# Altium schematic sheet DAC.SchDoc: DAC
size A4; Organization: Altium Limited; Address1: L3, 12a Rodborough Rd; Address2: Frenchs Forest; Address3: NSW; Address4: Australia 2086
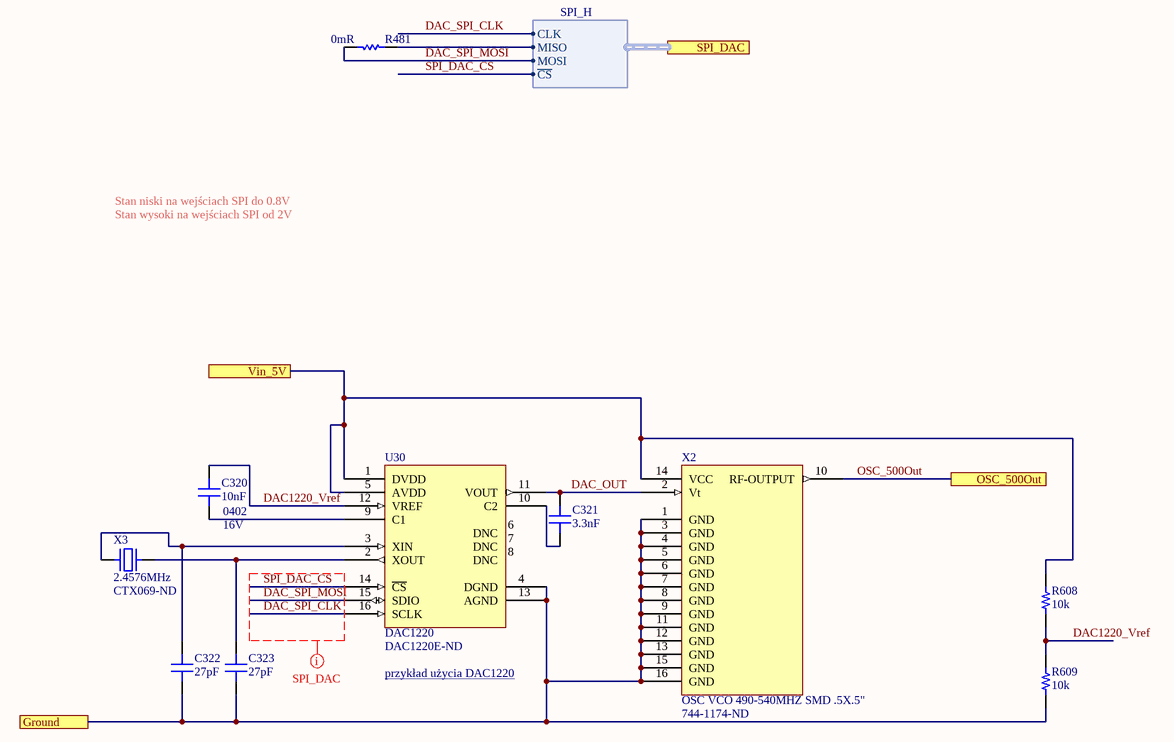
[diagram p0: DAC.SchDoc]

## Parts
C320  10nF  Case/Package: 0402  Voltage Rating (DC): 16V  [CAP 0402/1005 KK]
C321  3.3nF  [CAP 0603/1608 RF]
C322  27pF  [CAP 0402/1005 KK]
C323  27pF  [CAP 0402/1005 KK]
R481  0mR  [RES 0402/1005 RF KK]
R608  10k  [RES 0402/1005 RF KK]
R609  10k  [RES 0402/1005 RF KK]
U30  DAC1220  Supplier Part Number 1: DAC1220E-ND  [DAC1220]
X2  OSC VCO 490-540MHZ SMD .5X.5"  Supplier Part Number 1: 744-1174-ND  [CVCO55CW]
X3  2.4576MHz  Supplier Part Number 1: CTX069-ND  [Crystal]

## Ports
Ground, OSC_500Out, SPI_DAC (harness SPI_H), Vin_5V

## Harnesses
SPI_H: CLK, MISO, MOSI, ~{CS}

## Nets
DAC1220_Vref: C320.1 R608.2 R609.1 U30.12(VREF)
DAC_OUT: C321.2 U30.11(VOUT) X2.2(Vt)
DAC_SPI_CLK: U30.16(SCLK) ; port SPI_DAC.CLK
DAC_SPI_MOSI: R481.1 U30.15(SDIO) ; port SPI_DAC.MOSI
Ground: C322.1 C323.1 R609.2 U30.4(DGND) U30.13(AGND) X2.1(GND) X2.3(GND) X2.4(GND) X2.5(GND) X2.6(GND) X2.7(GND) X2.8(GND) X2.9(GND) X2.11(GND) X2.12(GND) X2.13(GND) X2.15(GND) X2.16(GND) ; port Ground
OSC_500Out: X2.10(RF-OUTPUT) ; port OSC_500Out
SPI_DAC_CS: U30.14(~{CS}) ; port SPI_DAC.~{CS}
Vin_5V: R608.1 U30.1(DVDD) U30.5(AVDD) X2.14(VCC) ; port Vin_5V
NetC320_2: C320.2 U30.9(C1)
NetC321_1: C321.1 U30.10(C2)
NetC322_2: C322.2 U30.3(XIN) X3.1
NetC323_2: C323.2 U30.2(XOUT) X3.2
NetR481_2: R481.2 ; port SPI_DAC.MISO

Not connected (* = marked no-connect by the designer): U30 6(DNC) 7(DNC) 8(DNC)

## Layout directives
net class SPI_DAC: DAC_SPI_CLK, DAC_SPI_MOSI, SPI_DAC_CS

## Notes on the sheet
- Stan niski na wejściach SPI do 0.8V
- Stan wysoki na wejściach SPI od 2V
- przykład użycia DAC1220 <http://www.ti.com/lit/ug/sbau102/sbau102.pdf>
- Title
- Size:
- Date:
- A3
- Number:
- Time:
- Revision:
- Sheet
- of
- File:

## Library data of the parts
C320 = Capacitor: Manufacturer: KEMET; Manufacturer Part Number: C0402C103K4RACTU; Dielectric Material: Ceramic; Tolerance: 10%; Dielectric: X7R; Dissipation Factor: 3.5%; Supplier 1: Digi-Key; Supplier Part Number 1: 399-1038-1-ND; Stock 1: 1112674; Pricing 1: 1 = 0,10000, 10 = 0,02800, 100 = 0,01240, 500 = 0,00886, 1000 = 0,00696, 2500 = 0,00632, 5000 = 0,00582 (USD); RoHS: Yes; Mount: Surface Mount,PCB; Number of Pins: 2; Case Code (Metric): 1005; Case Code (Imperial): 0402; Contact Plating: Tin,Matte; Min Operating Temperature: -55°C; Max Operating Temperature: 125°C; Capacitance: 10nF; Packaging: Tape and Reel; Package Quantity: 1; Voltage Rating: 16V; Termination: SMD/SMT; Voltage: 16V; Length: 1mm; Height: 0.5mm; Width: 0.02inch; Depth: 0.5mm; Thickness: 0.022inch; Lead Pitch: 0.3mm; Radiation Hardening: No; REACH SVHC: No SVHC; ComponentLink1URL: https://datasheet.ciiva.com/14595/70095383-14595321.pdf?src-supplier=Allied+Electronics; ComponentLink1Description: https://datasheet.ciiva.com/14595/70095383-14595321.pdf?src-supplier=Allied+Electronics; ComponentLink2URL: https://datasheet.ciiva.com/7747/kem-c1002-x7r-smd-7747614.pdf?src-supplier=Element14; ComponentLink2Description: https://datasheet.ciiva.com/7747/kem-c1002-x7r-smd-7747614.pdf?src-supplier=Element14
C321 = Capacitor: Manufacturer: Wurth Electronics; Manufacturer Part Number: 885012006016; Voltage Rating: 10V; Tolerance: 5%; Supplier 1: Digi-Key; Supplier Part Number 1: 732-7759-1-ND; Stock 1: 3926; Pricing 1: 1 = 0,10000, 10 = 0,08500, 100 = 0,07590, 500 = 0,06712 (USD); RoHS: Yes; Mount: Surface Mount; Case/Package: 0603; Case Code (Metric): 1608; Case Code (Imperial): 0603; Min Operating Temperature: -55°C; Max Operating Temperature: 125°C; Packaging: Tape and Reel; Capacitance: 3.3nF; Length: 0.063inch; Width: 0.031inch; Thickness: 0.034inch; ComponentLink1URL: https://katalog.we-online.de/pbs/datasheet/885012006016.pdf?src-supplier=Digi-Key; ComponentLink1Description: https://katalog.we-online.de/pbs/datasheet/885012006016.pdf?src-supplier=Digi-Key
C322 C323 = Capacitor: Manufacturer: KEMET; Manufacturer Part Number: C0402C270K5GACTU; Dielectric Material: Ceramic; Tolerance: 10%; Voltage Rating (DC): 50V; Dielectric: C0G; Supplier 1: Digi-Key; Supplier Part Number 1: 399-8960-1-ND; Stock 1: 1014365; Pricing 1: 1 = 0,10000, 10 = 0,02000, 100 = 0,00900, 500 = 0,00644, 1000 = 0,00506, 2500 = 0,00460, 5000 = 0,00423 (USD); RoHS: Yes; Mount: Surface Mount; Case/Package: 0402; Case Code (Metric): 1005; Case Code (Imperial): 0402; Min Operating Temperature: -55°C; Max Operating Temperature: 125°C; Capacitance: 27pF; Packaging: Tape and Reel; Package Quantity: 1; Voltage Rating: 50V; Termination: SMD/SMT; Length: 1mm; Height: 0.5mm; Depth: 0.5mm; Width: 0.02inch; Thickness: 0.022inch; Lead Pitch: 0.3mm; Lead Free: Lead Free; ComponentLink1URL: https://datasheet.ciiva.com/5413/kem-c1003-c0g-smd-5413929.pdf?src-supplier=Mouser; ComponentLink1Description: https://datasheet.ciiva.com/5413/kem-c1003-c0g-smd-5413929.pdf?src-supplier=Mouser
R481 = Resistor: Manufacturer 1: Yageo; Manufacturer Part Number 1: RC0402JR-070RL; Power Rating: 62.5mW; Tolerance: 5%; Voltage Rating: 50V; Max Power Dissipation: 63mW; Temperature Coefficient: 200ppm/°C; Supplier 1: Digi-Key; Supplier Part Number 1: 311-0.0JRCT-ND; Stock 1: 69822252; Pricing 1: 1=0.10000, 10=0.01200, 25=0.00920, 50=0.00680, 100=0.00510, 250=0.00388, 500=0.00308, 1000=0.00227, 5000=0.00163 (USD); RoHS: Yes; Case/Package: 0402; Contact Plating: Tin,Matte; Case Code (Metric): 1005; Case Code (Imperial): 0402; Min Operating Temperature: -55°C; Max Operating Temperature: 155°C; Resistance: 0mR; Packaging: Tape and Reel; Composition: Thick Film; Package Quantity: 1; Number of Terminations: 2; Termination: SMD/SMT; Military Standard: Not; Features: Moisture Resistant; Length: 1mm; Height: 0.016inch; Width: 0.02inch; Depth: 0.5mm; Radiation Hardening: No; REACH SVHC: Unknown; Lead Free: Lead Free; ComponentLink1URL: https://datasheet.ciiva.com/2452/pyu-rc0402-51-rohs-l-6-2452608.pdf?src-supplier=Digi-Key; ComponentLink1Description: https://datasheet.ciiva.com/2452/pyu-rc0402-51-rohs-l-6-2452608.pdf?src-supplier=Digi-Key; ComponentLink2URL: https://datasheet.ciiva.com/11808/0900766b80c66297-11808195.pdf?src-supplier=RSComponents; ComponentLink2Description: https://datasheet.ciiva.com/11808/0900766b80c66297-11808195.pdf?src-supplier=RSComponents; ComponentLink3URL: https://datasheet.ciiva.com/2452/pyu-r-int-thick-7-2452609.pdf?src-supplier=Digi-Key; ComponentLink3Description: https://datasheet.ciiva.com/2452/pyu-r-int-thick-7-2452609.pdf?src-supplier=Digi-Key; ComponentLink4URL: https://datasheet.ciiva.com/22747/1018594-22747515.pdf?src-supplier=Element14; ComponentLink4Description: https://datasheet.ciiva.com/22747/1018594-22747515.pdf?src-supplier=Element14; ComponentLink5URL: https://datasheet.ciiva.com/7983/1018594-7983535.pdf?src-supplier=Element14; ComponentLink5Description: https://datasheet.ciiva.com/7983/1018594-7983535.pdf?src-supplier=Element14; ComponentLink6URL: https://datasheet.ciiva.com/2452/pyu-r-int-thick-7-2452610.pdf?src-supplier=Digi-Key; ComponentLink6Description: https://datasheet.ciiva.com/2452/pyu-r-int-thick-7-2452610.pdf?src-supplier=Digi-Key; ComponentLink7URL: https://datasheet.ciiva.com/8896/pyu-rc0402-51-rohs-l-6-8896201.pdf?src-supplier=Avnet; ComponentLink7Description: https://datasheet.ciiva.com/8896/pyu-rc0402-51-rohs-l-6-8896201.pdf?src-supplier=Avnet; ComponentLink8URL: https://datasheet.ciiva.com/28386/pyu-rc0402-51-rohs-l-6-28386633.pdf?src-supplier=Avnet+Europe; ComponentLink8Description: https://datasheet.ciiva.com/28386/pyu-rc0402-51-rohs-l-6-28386633.pdf?src-supplier=Avnet+Europe; ComponentLink9URL: https://datasheet.ciiva.com/15189/getdatasheetpartid-326379-15189533.pdf?src-supplier=Verical; ComponentLink9Description: https://datasheet.ciiva.com/15189/getdatasheetpartid-326379-15189533.pdf?src-supplier=Verical
R608 R609 = Resistor: SMT Resistor; Value: 10k; Part Number: *; Supplier 1: Digi-Key; Supplier Part Number 1: RR05P10.0KDCT-ND
U30 = DAC1220: DAC 20bit; Manufacturer: Texas Instruments; Manufacturer Part Number: DAC1220E; Number of Bits: 20; Operating Supply Voltage: 5V; Interface: SPI; Resolution: 20b; Sampling Rate: 500S/s; Number of Channels: 1; Settling Time: 2000us; Output Type: Voltage; Max Supply Voltage: 5.25V; Min Supply Voltage: 4.75V; Power Consumption: 2.5mW; Nominal Supply Current: 460uA; Supply Type: Analog,Digital; Integral Nonlinearity (INL): 1LSB; Full Scale Error: 10LSB; Polarity: Unipolar; Supplier 1: Digi-Key; Stock 1: 237; Pricing 1: 1 = 19,80000, 10 = 18,19400, 25 = 17,44000, 100 = 15,36600, 500 = 13,66916 (USD); RoHS: Yes; Case/Package: SSOP; Number of Pins: 16; Weight: 0.002603oz; Contact Plating: Gold; Min Operating Temperature: -40°C; Max Operating Temperature: 85°C; Packaging: Rail/Tube; Package Quantity: 75; Number of Converters: 1; Conversion Rate: 500S/s; Number of DAC Channels: 1; Differential Nonlinearity: 1LSB; Length: 5mm; Height: 1.5mm; Width: 4mm; Radiation Hardening: No; Lead Free: Lead Free; REACH SVHC: No SVHC; ComponentLink1URL: https://datasheet.ciiva.com/1494/1762528-1494337.pdf?src-supplier=Element14; ComponentLink1Description: https://datasheet.ciiva.com/1494/1762528-1494337.pdf?src-supplier=Element14; ComponentLink2URL: https://datasheet.ciiva.com/25983/sbas082g-25983810.pdf?src-supplier=Avnet+Europe; ComponentLink2Description: https://datasheet.ciiva.com/25983/sbas082g-25983810.pdf?src-supplier=Avnet+Europe; ComponentLink3URL: https://datasheet.ciiva.com/14152/uz642298-e-14152445.pdf?src-supplier=Distrelec; ComponentLink3Description: https://datasheet.ciiva.com/14152/uz642298-e-14152445.pdf?src-supplier=Distrelec; ComponentLink4URL: https://datasheet.ciiva.com/26804/dac1220e-26804784.pdf?src-supplier=IIIC; ComponentLink4Description: https://datasheet.ciiva.com/26804/dac1220e-26804784.pdf?src-supplier=IIIC; ComponentLink5URL: https://datasheet.ciiva.com/15146/getdatasheetpartid-224186-15146981.pdf?src-supplier=Verical; ComponentLink5Description: https://datasheet.ciiva.com/15146/getdatasheetpartid-224186-15146981.pdf?src-supplier=Verical; ComponentLink6URL: https://datasheet.ciiva.com/3040/sbas082g-3040444.pdf?src-supplier=Avnet; ComponentLink6Description: https://datasheet.ciiva.com/3040/sbas082g-3040444.pdf?src-supplier=Avnet; ComponentLink7URL: https://datasheet.ciiva.com/1364/dac1220-1364430.pdf?src-supplier=Digi-Key; ComponentLink7Description: https://datasheet.ciiva.com/1364/dac1220-1364430.pdf?src-supplier=Digi-Key
X2 = CVCO55CL-0490-0540: Manufacturer: Crystek; Frequency: 540MHz; Load Capacitance: 100pF; Max Supply Voltage: 5.25V; Min Supply Voltage: 4.75V; Supplier 1: Digi-Key; Manufacturer Part Number: CVCO55CL-0490-0540; Stock 1: 6; Pricing 1: 1 = 24,31000, 5 = 23,20600, 10 = 20,99500, 25 = 19,89000, 50 = 18,78500 (USD); RoHS: Yes; Mount: Surface Mount; Case/Package: SMD/SMT; Number of Pins: 16; Min Operating Temperature: -40°C; Max Operating Temperature: 85°C; Package Quantity: 5; Packaging: Cut Tape; Termination: SMD/SMT; Length: 0.5inch; Height: 0.15inch; Width: 0.5inch; ComponentLink1URL: https://datasheet.ciiva.com/884/cvco55cl-0490-0540-884171.pdf?src-supplier=Digi-Key; ComponentLink1Description: https://datasheet.ciiva.com/884/cvco55cl-0490-0540-884171.pdf?src-supplier=Digi-Key; ComponentLink2URL: https://datasheet.ciiva.com/12381/cvco55cl-0490-0540-32994-12381581.pdf?src-supplier=Mouser; ComponentLink2Description: https://datasheet.ciiva.com/12381/cvco55cl-0490-0540-32994-12381581.pdf?src-supplier=Mouser; ComponentLink3URL: https://datasheet.ciiva.com/14620/70051761-14620845.pdf?src-supplier=Allied+Electronics; ComponentLink3Description: https://datasheet.ciiva.com/14620/70051761-14620845.pdf?src-supplier=Allied+Electronics
X3 = MP024S: CRYSTAL 2.4576MHZ 32PF T/H; Manufacturer: CTS; Frequency Tolerance: 30ppm; Frequency Stability: 50ppm; ESR (Equivalent Series Resistance): 300R; Supplier 1: Digi-Key; Manufacturer Part Number: MP024S; Stock 1: 2166; Pricing 1: 1 = 1,14000, 10 = 1,08500, 50 = 1,05980, 100 = 0,90850, 500 = 0,88322, 1000 = 0,74443, 2500 = 0,70658, 5000 = 0,68135, 10000 = 0,65611 (USD); RoHS: Yes; Mount: Through Hole; Number of Pins: 2; Min Operating Temperature: -20°C; Max Operating Temperature: 70°C; Packaging: Bulk; Load Capacitance: 32pF; Frequency: 2.4576MHz; Package Quantity: 100; Tolerance: 30ppm; Termination: Radial; Series Resistance: 300R; Length: 10.85mm; Height: 0.53inch; Width: 0.15inch; Depth: 3.8mm; Radiation Hardening: No; Lead Free: Lead Free; ComponentLink1URL: https://datasheet.ciiva.com/27056/2039161-27056418.pdf?src-supplier=Jameco; ComponentLink1Description: https://datasheet.ciiva.com/27056/2039161-27056418.pdf?src-supplier=Jameco; ComponentLink2URL: https://datasheet.ciiva.com/15116/getdatasheetpartid-123295-15116382.pdf?src-supplier=Verical; ComponentLink2Description: https://datasheet.ciiva.com/15116/getdatasheetpartid-123295-15116382.pdf?src-supplier=Verical; ComponentLink3URL: https://datasheet.ciiva.com/854/008-0308-0-854108.pdf?src-supplier=Digi-Key; ComponentLink3Description: https://datasheet.ciiva.com/854/008-0308-0-854108.pdf?src-supplier=Digi-Key